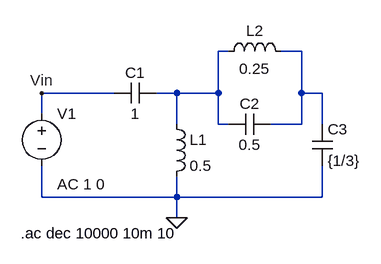
[diagram p0: schematic circuito_2_valores.asc]
circuito_2_valores.asc, the LTspice schematic file:
Version 4.1
SHEET 1 880 680
WIRE 240 48 224 48
WIRE 352 48 320 48
WIRE 64 112 -48 112
WIRE 160 112 128 112
WIRE 224 112 224 48
WIRE 224 112 160 112
WIRE 352 112 352 48
WIRE 384 112 352 112
WIRE -48 144 -48 112
WIRE 160 160 160 112
WIRE 224 160 224 112
WIRE 240 160 224 160
WIRE 352 160 352 112
WIRE 352 160 304 160
WIRE 384 160 384 112
WIRE -48 272 -48 224
WIRE 160 272 160 240
WIRE 160 272 -48 272
WIRE 384 272 384 224
WIRE 384 272 160 272
WIRE 160 304 160 272
FLAG 160 304 0
FLAG -48 112 Vin
SYMBOL cap 128 96 R90
WINDOW 0 0 32 VBottom 2
WINDOW 3 32 32 VTop 2
SYMATTR InstName C1
SYMATTR Value 1
SYMBOL ind 144 144 R0
SYMATTR InstName L1
SYMATTR Value 0.5
SYMATTR SpiceLine Rser=1m
SYMBOL ind 224 64 R270
WINDOW 0 32 56 VTop 2
WINDOW 3 5 56 VBottom 2
SYMATTR InstName L2
SYMATTR Value 0.25
SYMATTR SpiceLine Rser=1m
SYMBOL cap 304 144 R90
WINDOW 0 0 32 VBottom 2
WINDOW 3 32 32 VTop 2
SYMATTR InstName C2
SYMATTR Value 0.5
SYMBOL cap 368 160 R0
SYMATTR InstName C3
SYMATTR Value {1/3}
SYMBOL voltage -48 128 R0
WINDOW 123 24 124 Left 2
WINDOW 39 0 0 Left 0
SYMATTR InstName V1
SYMATTR Value ""
SYMATTR Value2 AC 1 0
TEXT -80 328 Left 2 !.ac dec 10000 10m 10

The netlist it stands for:
* circuito_2_valores.asc
C1 N001 Vin 1
L1 N001 0 0.5 Rser=1m
L2 N001 N002 0.25 Rser=1m
C2 N002 N001 0.5
C3 N002 0 {1/3}
V1 Vin 0 AC 1 0
.ac dec 10000 10m 10
.backanno
.end